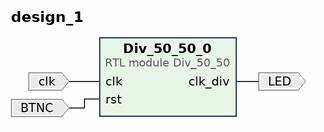
[diagram p0: block diagram of the top level]
# Vivado block design design_1, xc7a100tcsg324-1, Vivado 2017.4.1
create_bd_design design_1

create_bd_port -dir I -type clk clk
create_bd_port -dir I -type rst BTNC
create_bd_port -dir O LED

create_bd_cell -type module -reference Div_50_50 Div_50_50_0

# ---- connections ----

connect_bd_net -net clk_0_1 [get_bd_ports clk] [get_bd_pins Div_50_50_0/clk]
connect_bd_net -net rst_0_1 [get_bd_ports BTNC] [get_bd_pins Div_50_50_0/rst]
connect_bd_net [get_bd_pins Div_50_50_0/clk_div] [get_bd_ports LED]

validate_bd_design
save_bd_design
